# EasyEDA Pro project ProDoc_Main_Board_2026-11-15.epro

# Schematic Main_Board
Create Date: 2026-05-24; Page Name: P1; Project Name: Peeling_Instrument_Golan; Schematic Name: Main_Board; Update Date: 2026-05-25; Company: EasyEDA.com; Page Size: A4; Version: V1.0
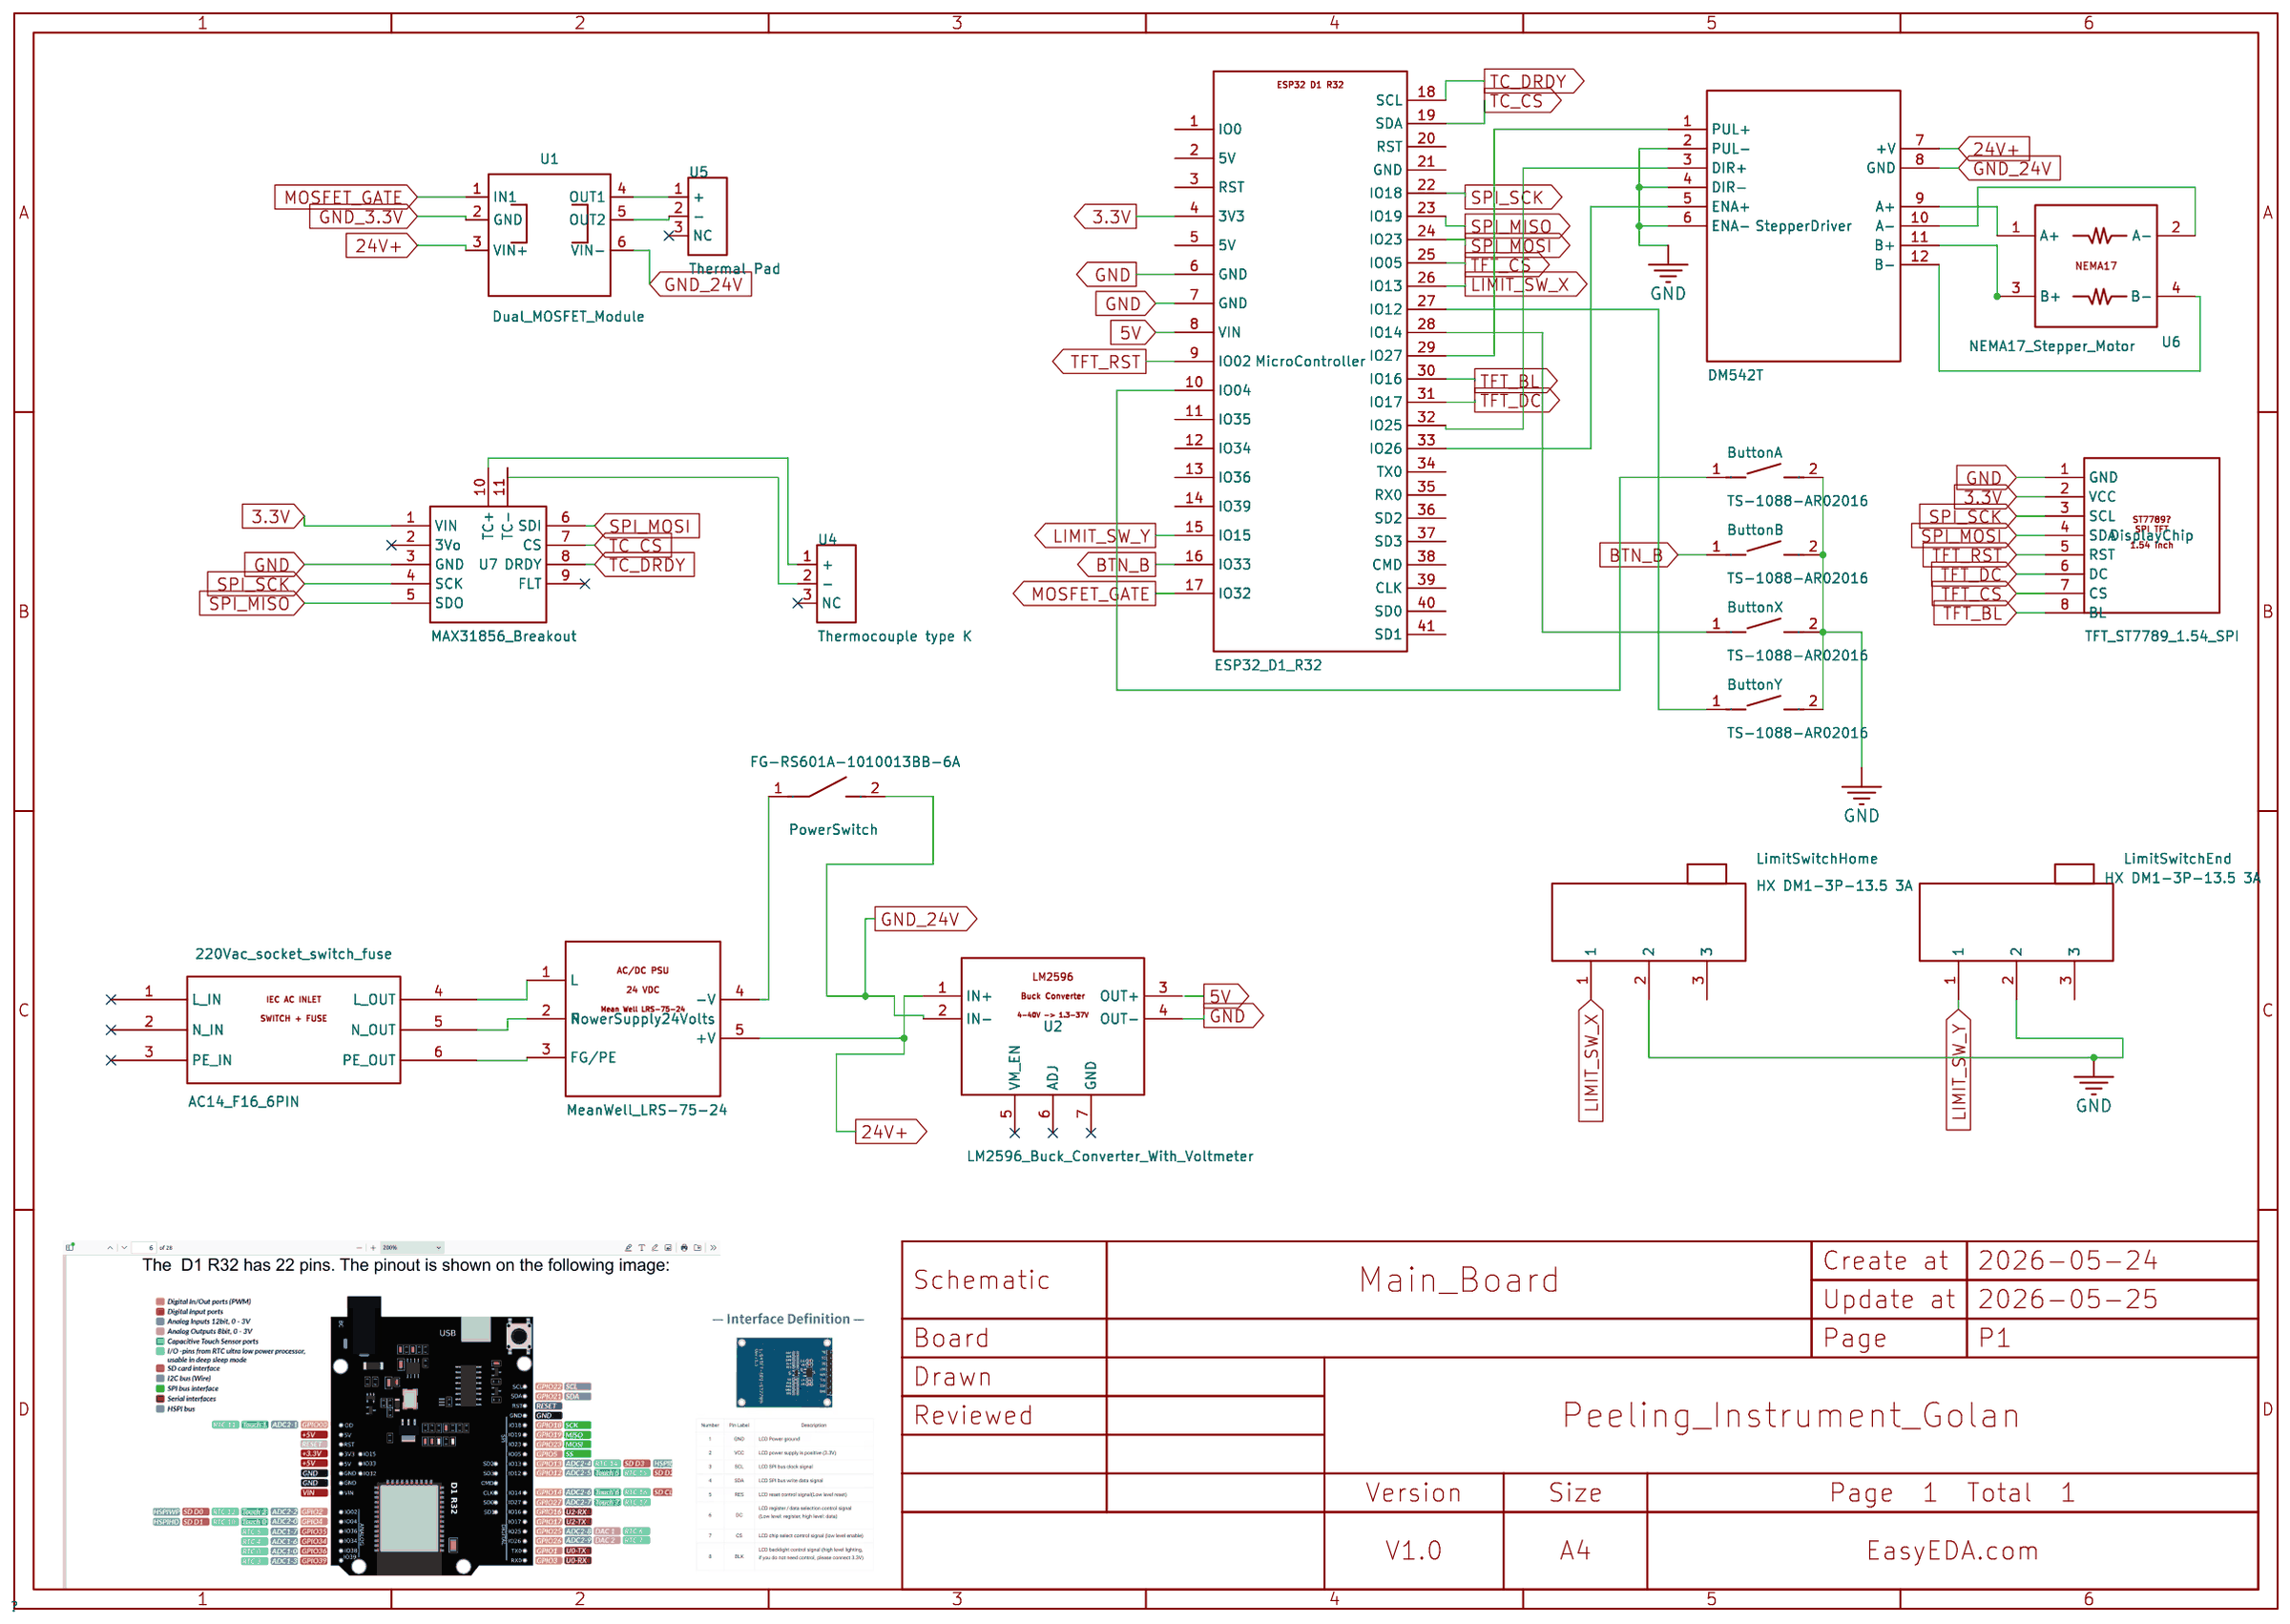
[diagram p0: schematic sheet]

## Parts
220Vac_socket_switch_fuse  AC14_F16_6PIN
ButtonA  TS-1088-AR02016  [SW-SMD_L3.9-W3.0-P4.45]
ButtonB  TS-1088-AR02016  [SW-SMD_L3.9-W3.0-P4.45]
ButtonX  TS-1088-AR02016  [SW-SMD_L3.9-W3.0-P4.45]
ButtonY  TS-1088-AR02016  [SW-SMD_L3.9-W3.0-P4.45]
DisplayChip  TFT_ST7789_1.54_SPI
LimitSwitchEnd  HX DM1-3P-13.5 3A  [SW-TH_HX-DM1-3P-13.5]
LimitSwitchHome  HX DM1-3P-13.5 3A  [SW-TH_HX-DM1-3P-13.5]
MicroController  ESP32_D1_R32
PowerSupply24Volts  MeanWell_LRS-75-24
PowerSwitch  FG-RS601A-1010013BB-6A  [SW-TH_FG-RS601A-1010013BB-6A]
StepperDriver  DM542T
U1  Dual_MOSFET_Module
U2  LM2596_Buck_Converter_With_Voltmeter
U4  Thermocouple type K  [SENSOR-TH_AD590JCHIPS]
U5  Thermal Pad  [SENSOR-TH_AD590JCHIPS]
U6  NEMA17_Stepper_Motor
U7  MAX31856_Breakout

## Library data of the parts
220Vac_socket_switch_fuse = AC14_F16_6PIN
ButtonA ButtonB ButtonX ButtonY = TS-1088-AR02016: Circuit:SPST Actuator Style:Round Button Operating Force:1.6N Mounting Type:Surface Mount,Vertical Length:4mm Width:3mm Switch Height:2mm with Bracket:Without Bracket Contact Current:50mA Voltage Rating:12V Actuator/Cap Color:Black Termination Style:SMD(S; LCSC Part Name: 4*3*2mm 立贴 轻触开关; Supplier Part: C720477; Manufacturer: XUNPU(讯普); Supplier Footprint: SMD,4x3mm; JLCPCB Part Class: Basic Part; Datasheet: https://item.szlcsc.com/datasheet/TS-1088-AR02016/763484.html; Supplier: LCSC; Circuit: SPST; Actuator Style: Round Button; Operating Force: 1.6N; Mounting Type: Surface Mount,Vertical; Length: 4mm; Width: 3mm; Switch Height: 2mm; with Bracket: Without Bracket; Contact Current: 50mA; Voltage Rating: 12V; Actuator/Cap Color: Black; Termination Style: SMD(SMT) Tab; Life: 100,000 Cycles; Operating Temperature: -30℃~+80℃
DisplayChip = TFT_ST7789_1.54_SPI
LimitSwitchEnd LimitSwitchHome = HX DM1-3P-13.5 3A: Circuit:SPST Actuator Style:Straight Lever Length:12.8mm Width:5.7mm Switch Height:10mm Current Rating (DC):- Voltage Rating (DC):- Current Rating (AC):3A Voltage Rating (AC):125V Life:30,000 cycles Termination Style:PC Pin Operating Temperature:-25℃~+85℃; LCSC Part Name: 小型鼠标3脚微动行程开关 带直柄13.5mm 大电流3A; Supplier Part: C25168852; Manufacturer: hanxia(韩下); Supplier Footprint: SIP-3P,12.8x5.7mm; JLCPCB Part Class: Extended Part; Datasheet: https://item.szlcsc.com/datasheet/HX%2520DM1-3P-13.5%25203A/26898594.html; Supplier: LCSC; Circuit: SPST; Actuator Style: Straight Lever; Length: 12.8mm; Width: 5.7mm; Switch Height: 10mm; Current Rating (AC): 3A; Voltage Rating (AC): 125V; Life: 30,000 cycles; Termination Style: PC Pin; Operating Temperature: -25℃~+85℃
MicroController = ESP32_D1_R32
PowerSupply24Volts = MeanWell_LRS-75-24
PowerSwitch = FG-RS601A-1010013BB-6A: Supplier Part: C54529748; Manufacturer: FG(富港); Supplier Footprint: 插件; JLCPCB Part Class: Extended Part; Datasheet: https://item.szlcsc.com/datasheet/FG-RS601A-1010013BB-6A/57881949.html; Supplier: LCSC
StepperDriver = DM542T
U1 = Dual_MOSFET_Module
U2 = LM2596_Buck_Converter_With_Voltmeter
U4 U5 = AD590JCHIPS: Detection Temperature Range:- Detection Temperature Range:- Tolerance:±5℃ Tolerance:±5℃ Voltage - Supply:4V~30V Voltage - Supply:4V~30V Features:-; Supplier Part: C3663389; Manufacturer: ADI(亚德诺); JLCPCB Part Class: Extended Part; Datasheet: https://item.szlcsc.com/datasheet/AD590JCHIPS/4231188.html; Supplier: LCSC; Tolerance: ±5℃; Voltage - Supply: 4V~30V
U6 = NEMA17_Stepper_Motor
U7 = MAX31856_Breakout

## Nets
3.3V: DisplayChip.2(VCC) MicroController.4(3V3) U7.1(VIN)
5V: MicroController.8(VIN)
24V+: PowerSupply24Volts.5(+V) StepperDriver.7(+V) U1.3(VIN+) U2.1(IN+)
GND: ButtonA.2 ButtonB.2 ButtonX.2 ButtonY.2 DisplayChip.1(GND) LimitSwitchEnd.2 LimitSwitchHome.2 MicroController.6(GND) MicroController.7(GND) StepperDriver.2(PUL-) StepperDriver.4(DIR-) StepperDriver.6(ENA-) U2.4(OUT-) U7.3(GND)
GND_3.3V: U1.2(GND)
GND_24V: PowerSwitch.2 StepperDriver.8(GND) U1.6(VIN-) U2.2(IN-)
BTN_B: ButtonB.1 MicroController.16(IO33)
LIMIT_SW_X: LimitSwitchHome.1 MicroController.26(IO13)
LIMIT_SW_Y: LimitSwitchEnd.1 MicroController.15(IO15)
MOSFET_GATE: MicroController.17(IO32) U1.1(IN1)
SPI_MISO: MicroController.23(IO19) U7.5(SDO)
SPI_MOSI: DisplayChip.4(SDA) MicroController.24(IO23) U7.6(SDI)
SPI_SCK: DisplayChip.3(SCL) MicroController.22(IO18) U7.4(SCK)
TC_CS: MicroController.19(SDA) U7.7(CS)
TC_DRDY: MicroController.18(SCL) U7.8(DRDY)
TFT_BL: DisplayChip.8(BL) MicroController.30(IO16)
TFT_CS: DisplayChip.7(CS) MicroController.25(IO05)
TFT_DC: DisplayChip.6(DC) MicroController.31(IO17)
TFT_RST: DisplayChip.5(RST) MicroController.9(IO02)
Net-(220Vac_socket_switch_fuse-4): 220Vac_socket_switch_fuse.4(L_OUT) PowerSupply24Volts.1(L)
Net-(220Vac_socket_switch_fuse-5): 220Vac_socket_switch_fuse.5(N_OUT) PowerSupply24Volts.2(N)
Net-(220Vac_socket_switch_fuse-6): 220Vac_socket_switch_fuse.6(PE_OUT) PowerSupply24Volts.3(FG/PE)
Net-(ButtonA-1): ButtonA.1 MicroController.10(IO04)
Net-(ButtonX-1): ButtonX.1 MicroController.28(IO14)
Net-(ButtonY-1): ButtonY.1 MicroController.27(IO12)
Net-(MicroController-29): MicroController.29(IO27) StepperDriver.1(PUL+)
Net-(MicroController-32): MicroController.32(IO25) StepperDriver.3(DIR+)
Net-(MicroController-33): MicroController.33(IO26) StepperDriver.5(ENA+)
Net-(PowerSupply24Volts-4): PowerSupply24Volts.4(-V) PowerSwitch.1
Net-(StepperDriver-9): StepperDriver.9(A+) U6.1(A+)
Net-(StepperDriver-10): StepperDriver.10(A-) U6.2(A-)
Net-(StepperDriver-11): StepperDriver.11(B+) U6.3(B+)
Net-(StepperDriver-12): StepperDriver.12(B-) U6.4(B-)
Net-(U1-4): U1.4(OUT1) U5.1(+)
Net-(U1-5): U1.5(OUT2) U5.2(−)
Net-(U4-1): U4.1(+) U7.10(TC+)
Net-(U4-2): U4.2(−) U7.11(TC-)

Not connected (* = marked no-connect by the designer): 220Vac_socket_switch_fuse 1(L_IN)* 2(N_IN)* 3(PE_IN)*; LimitSwitchEnd 3; LimitSwitchHome 3; MicroController 1(IO0) 2(5V) 3(RST) 5(5V) 11(IO35) 12(IO34) 13(IO36) 14(IO39) 20(RST) 21(GND) 34(TX0) 35(RX0) 36(SD2) 37(SD3) 38(CMD) 39(CLK) 40(SD0) 41(SD1); U2 3(OUT+) 5(VM_EN)* 6(ADJ)* 7(GND)*; U4 3(NC)*; U5 3(NC)*; U7 2(3Vo)* 9(FLT)*
